# Altium schematic sheet LAN 485.SchDoc
size A3; SheetNumber: 2; SheetTotal: 3
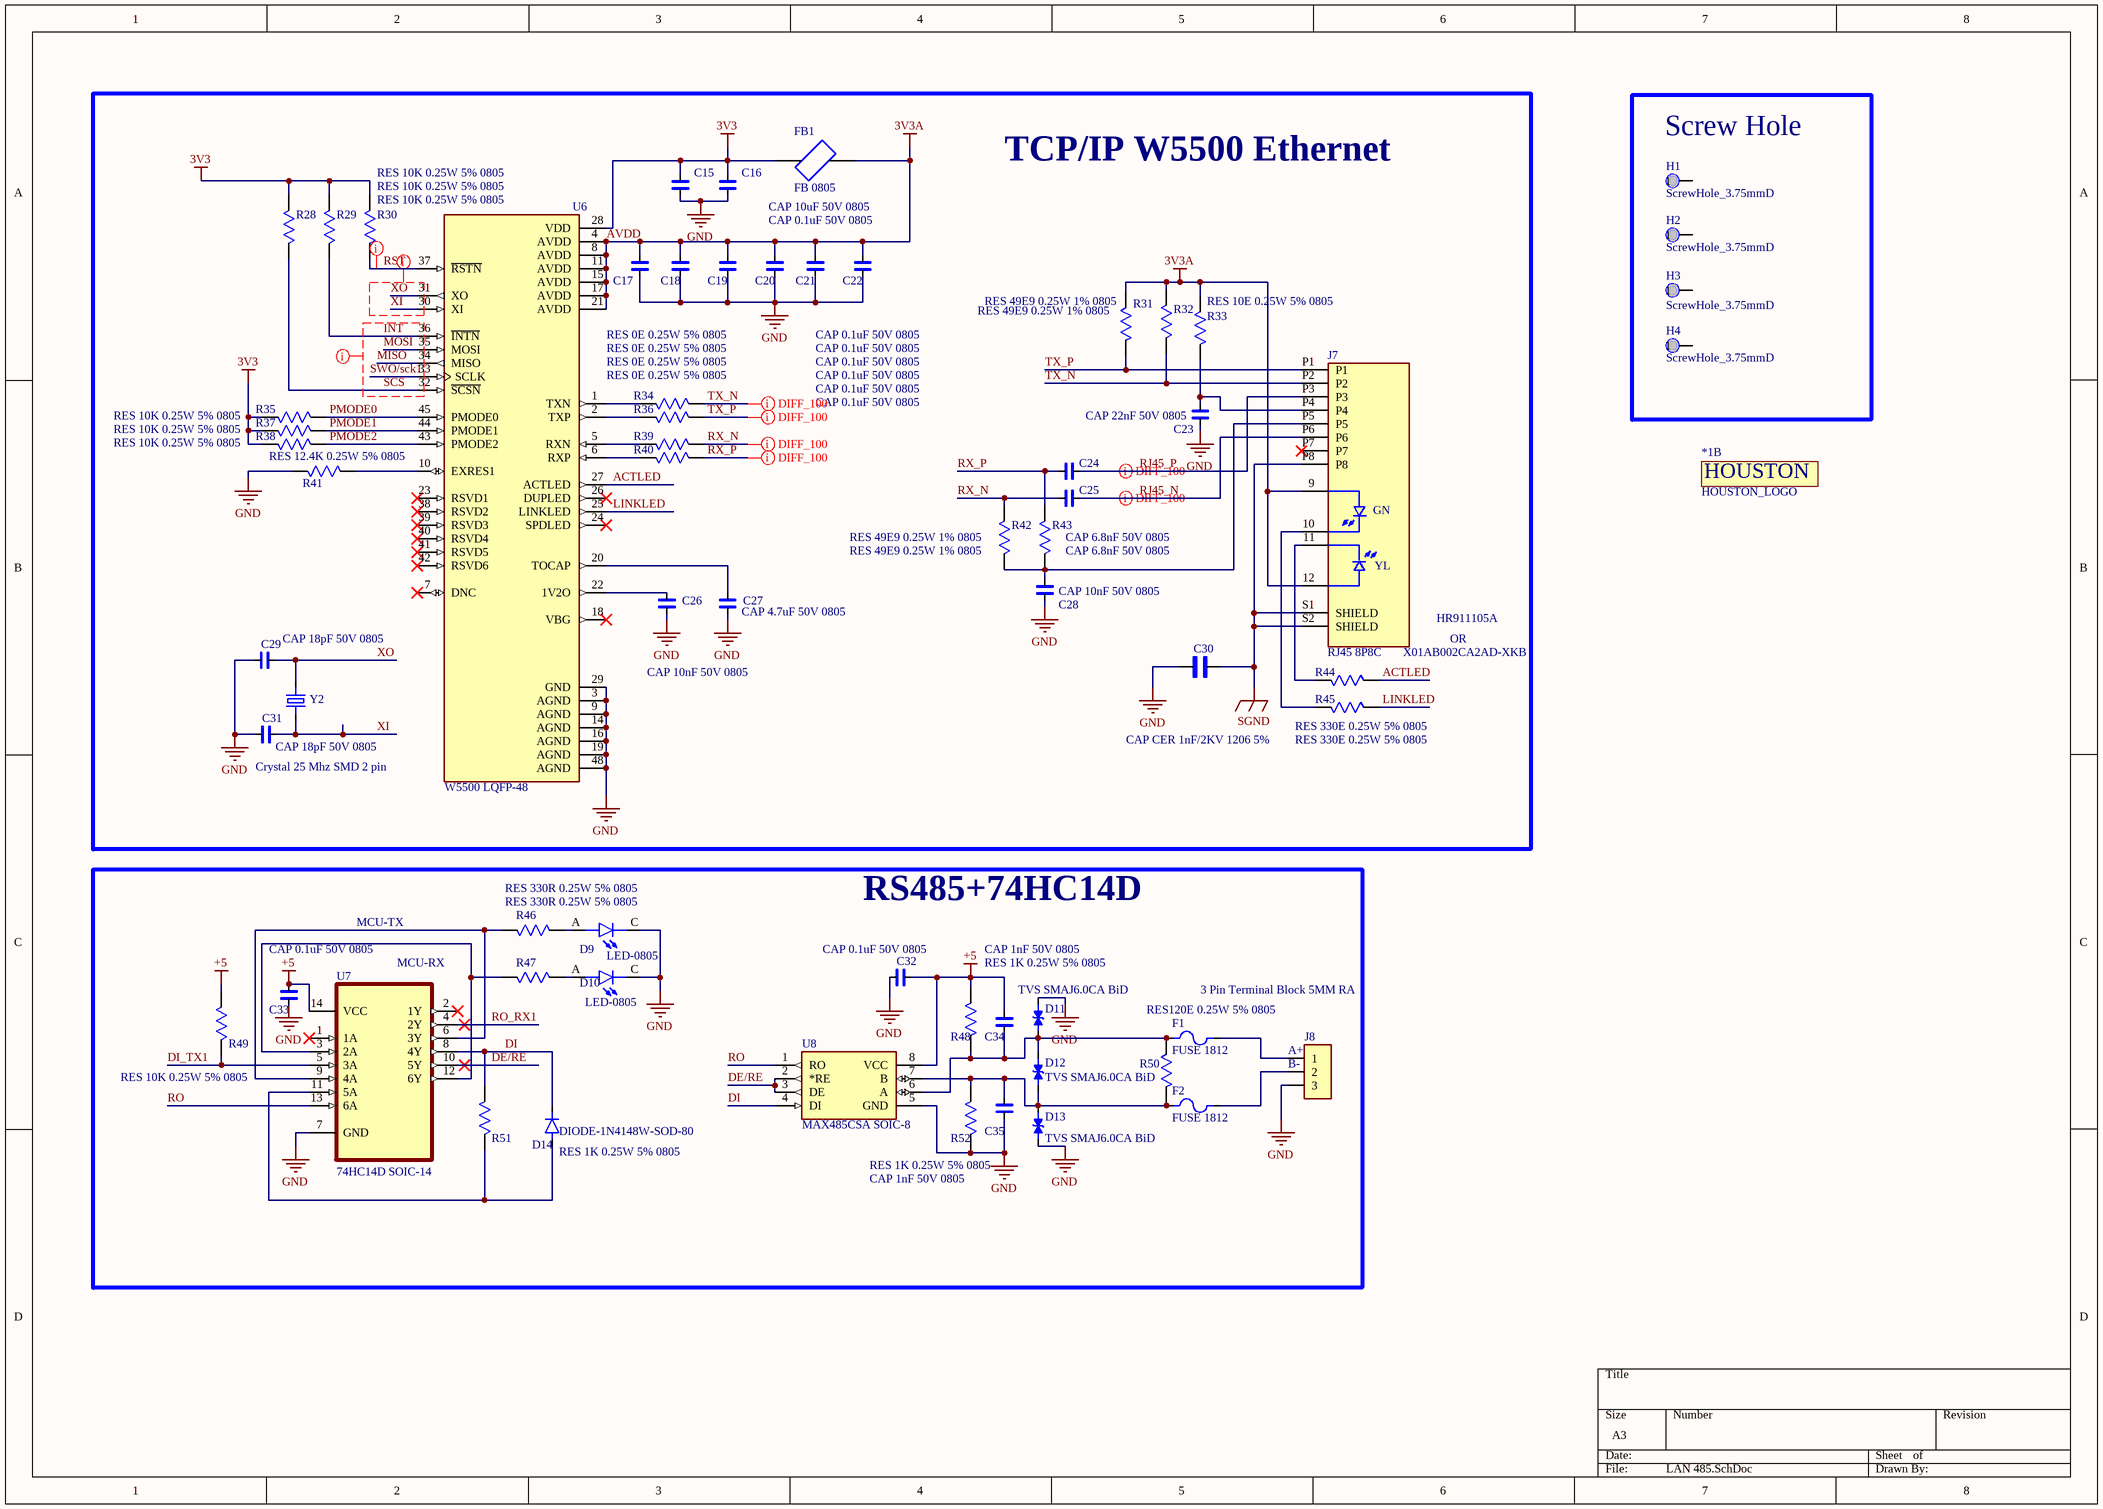
[diagram p0: LAN 485.SchDoc]

## Parts
*1  HOUSTON_LOGO  [HOUSTON_LOGO]  (part B of 2)
C15  CAP 0.1uF 50V 0805  [CAP CER 0.1uF/50V 5%]
C16  CAP 10uF 50V 0805  [CAP CER 0.1uF/50V 5%]
C17  CAP 0.1uF 50V 0805  [CAP CER 0.1uF/50V 5%]
C18  CAP 0.1uF 50V 0805  [CAP CER 0.1uF/50V 5%]
C19  CAP 0.1uF 50V 0805  [CAP CER 0.1uF/50V 5%]
C20  CAP 0.1uF 50V 0805  [CAP CER 0.1uF/50V 5%]
C21  CAP 0.1uF 50V 0805  [CAP CER 0.1uF/50V 5%]
C22  CAP 0.1uF 50V 0805  [CAP CER 0.1uF/50V 5%]
C23  CAP 22nF 50V 0805  [CAP CER 0.1uF/50V 5%]
C24  CAP 6.8nF 50V 0805  [CAP CER 0.1uF/50V 5%]
C25  CAP 6.8nF 50V 0805  [CAP CER 0.1uF/50V 5%]
C26  CAP 10nF 50V 0805  [CAP CER 0.1uF/50V 5%]
C27  CAP 4.7uF 50V 0805  [CAP CER 0.1uF/50V 5%]
C28  CAP 10nF 50V 0805  [CAP CER 0.1uF/50V 5%]
C29  CAP 18pF 50V 0805  [CAP CER 0.1uF/50V 5%]
C30  CAP CER 1nF/2KV 1206 5%  [CAP CER 1nF/2KV 1206 5%]
C31  CAP 18pF 50V 0805  [CAP CER 0.1uF/50V 5%]
C32  CAP 0.1uF 50V 0805  [CAP CER 0.1uF/50V 5%]
C33  CAP 0.1uF 50V 0805  [CAP CER 0.1uF/50V 5%]
C34  CAP 1nF 50V 0805  [CAP CER 0.1uF/50V 5%]
C35  CAP 1nF 50V 0805  [CAP CER 0.1uF/50V 5%]
D9  LED-0805  [LED-0805]
D10  LED-0805  [LED-0805]
D11  TVS SMAJ6.0CA BiD  [TVS SMAJ6.0CA DO-214AC (SMA)]
D12  TVS SMAJ6.0CA BiD  [TVS SMAJ6.0CA DO-214AC (SMA)]
D13  TVS SMAJ6.0CA BiD  [TVS SMAJ6.0CA DO-214AC (SMA)]
D14  DIODE-1N4148W-SOD-80  [DIODE-1N4148W-SOD-80]
F1  FUSE 1812  [FUSE 1812]
F2  FUSE 1812  [FUSE 1812]
FB1  FB 0805  [FB 0805]
H1  ScrewHole_3.75mmD  [ScrewHole_3.75mmD - duplicate]
H2  ScrewHole_3.75mmD  [ScrewHole_3.75mmD - duplicate]
H3  ScrewHole_3.75mmD  [ScrewHole_3.75mmD - duplicate]
H4  ScrewHole_3.75mmD  [ScrewHole_3.75mmD - duplicate]
J7  RJ45 8P8C  [RJ45 8P8C]
J8  3 Pin Terminal Block 5MM RA  [3 Pin Terminal Block 5MM RA]
R28  RES 10K 0.25W 5% 0805  [RES 0805 10K/0.25W 5%]
R29  RES 10K 0.25W 5% 0805  [RES 0805 10K/0.25W 5%]
R30  RES 10K 0.25W 5% 0805  [RES 0805 10K/0.25W 5%]
R31  RES 49E9 0.25W 1% 0805  [RES 0805 10K/0.25W 5%]
R32  RES 49E9 0.25W 1% 0805  [RES 0805 10K/0.25W 5%]
R33  RES 10E 0.25W 5% 0805  [RES 0805 10K/0.25W 5%]
R34  RES 0E 0.25W 5% 0805  [RES 0805 10K/0.25W 5%]
R35  RES 10K 0.25W 5% 0805  [RES 0805 10K/0.25W 5%]
R36  RES 0E 0.25W 5% 0805  [RES 0805 10K/0.25W 5%]
R37  RES 10K 0.25W 5% 0805  [RES 0805 10K/0.25W 5%]
R38  RES 10K 0.25W 5% 0805  [RES 0805 10K/0.25W 5%]
R39  RES 0E 0.25W 5% 0805  [RES 0805 10K/0.25W 5%]
R40  RES 0E 0.25W 5% 0805  [RES 0805 10K/0.25W 5%]
R41  RES 12.4K 0.25W 5% 0805  [RES 0805 10K/0.25W 5%]
R42  RES 49E9 0.25W 1% 0805  [RES 0805 10K/0.25W 5%]
R43  RES 49E9 0.25W 1% 0805  [RES 0805 10K/0.25W 5%]
R44  RES 330E 0.25W 5% 0805  [RES 0805 10K/0.25W 5%]
R45  RES 330E 0.25W 5% 0805  [RES 0805 10K/0.25W 5%]
R46  RES 330R 0.25W 5% 0805  [RES 0805 10K/0.25W 5%]
R47  RES 330R 0.25W 5% 0805  [RES 0805 10K/0.25W 5%]
R48  RES 1K 0.25W 5% 0805  [RES 0805 10K/0.25W 5%]
R49  RES 10K 0.25W 5% 0805  [RES 0805 10K/0.25W 5%]
R50  RES120E 0.25W 5% 0805  [RES 0805 10K/0.25W 5%]
R51  RES 1K 0.25W 5% 0805  [RES 0805 10K/0.25W 5%]
R52  RES 1K 0.25W 5% 0805  [RES 0805 10K/0.25W 5%]
U6  W5500 LQFP-48  [W5500 LQFP-48]
U7  74HC14D SOIC-14  [74HC14D SOIC-14]
U8  MAX485CSA SOIC-8  [MAX485CSA]
Y2  Crystal 25 Mhz SMD 2 pin  [Crystal 16 Mhz SMD 2 pin]

## Blocks framed on the sheet
TCP/IP W5500 Ethernet: C15-C31 FB1 J7 R28-R45 U6 Y2
Screw Hole: H1-H4
RS485+74HC14D: C32-C35 D9-D14 F1 F2 J8 R46-R52 U7 U8

## Nets
3V3: C15.2 C16.2 FB1.1 R28.2 R29.2 R30.2 R35.2 R37.2 R38.2 U6.28(VDD)
+5: C32.1 C33.2 C34.2 R48.1 R49.2 U7.14(VCC) U8.8(VCC)
AVDD: C17.2 C18.2 C19.2 C20.2 C21.2 C22.2 FB1.2 J7.9 J7.12 R31.2 R32.2 R33.2 U6.4(AVDD) U6.8(AVDD) U6.11(AVDD) U6.15(AVDD) U6.17(AVDD) U6.21(AVDD)  [also labelled 3V3A]
GND: C15.1 C16.1 C17.1 C18.1 C19.1 C20.1 C21.1 C22.1 C23.1 C26.1 C27.1 C28.1 C29.2 C30.1 C31.2 C32.2 C33.1 C35.2 D9.C D10.C D11.2 D13.1 J8.3 R41.1 R52.1 U6.3(AGND) U6.9(AGND) U6.14(AGND) U6.16(AGND) U6.19(AGND) U6.29(GND) U6.48(AGND) U7.7(GND) U8.5(GND)
SGND: C30.2 J7.P8 J7.S1(SHIELD) J7.S2(SHIELD)
ACTLED: R44.1 U6.27(ACTLED)
DE/RE: U7.10(5Y) U8.2(*RE) U8.3(DE)
DI: D14.C(K) R51.2 U7.8(4Y) U8.4(DI)
DI_TX1: R49.1 U7.5(3A)
INT: R29.1 U6.36(~{INTN})
LINKLED: R45.1 U6.25(LINKLED)
MISO: U6.34(MISO)
MOSI: U6.35(MOSI)
PMODE0: R35.1 U6.45(PMODE0)
PMODE1: R37.1 U6.44(PMODE1)
PMODE2: R38.1 U6.43(PMODE2)
RJ45_N: C25.1 J7.P6
RJ45_P: C24.1 J7.P3
RO: U7.13(6A) U8.1(RO)
RO_RX1: U7.4(2Y)
RST: R30.1 U6.37(~{RSTN})
RX_N: C25.2 R39.1 R42.2
RX_P: C24.2 R40.1 R43.2
SCS: R28.1 U6.32(~{SCSN})
SWO/sck1: U6.33(SCLK)
TX_N: J7.P2 R32.1 R34.1
TX_P: J7.P1 R31.1 R36.1
XI: C31.1 U6.30(XI) Y2.2
XO: C29.1 U6.31(XO) Y2.1
NetC23_2: C23.2 J7.P4 R33.1
NetC26_2: C26.2 U6.22(1V2O)
NetC27_2: C27.2 U6.20(TOCAP)
NetC28_2: C28.2 J7.P5 R42.1 R43.1
NetC34_1: C34.1 D11.1 D12.2 F1.1 R48.2 R50.2 U8.6(A)
NetC35_1: C35.1 D12.1 D13.2 F2.1 R50.1 R52.2 U8.7(B)
NetD9_A: D9.A R46.1
NetD10_A: D10.A R47.1
NetD14_A: D14.A R51.1 U7.11(5A)
NetF1_2: F1.2 J8.1
NetF2_2: F2.2 J8.2
NetJ7_10: J7.10 R45.2
NetJ7_11: J7.11 R44.2
NetR34_2: R34.2 U6.1(TXN)
NetR36_2: R36.2 U6.2(TXP)
NetR39_2: R39.2 U6.5(RXN)
NetR40_2: R40.2 U6.6(RXP)
NetR41_2: R41.2 U6.10(EXRES1)
NetR46_2: R46.2 U7.6(3Y) U7.9(4A)
NetR47_2: R47.2 U7.3(2A) U7.12(6Y)

Not connected (* = marked no-connect by the designer): H1 1; H2 1; H3 1; H4 1; J7 P7*; U6 7(DNC)* 18(VBG)* 23(RSVD1)* 24(SPDLED)* 26(DUPLED)* 38(RSVD2)* 39(RSVD3)* 40(RSVD4)* 41(RSVD5)* 42(RSVD6)*; U7 1(1A)* 2(1Y)*

## Layout directives
net class Single_50 ohm: INT, MISO, MOSI, RST, SCS, SWO/sck1, XI, XO
differential pair; differential pair class DIFF_100: RJ45_N, RJ45_P, RX_N, RX_P, TX_N, TX_P

## Notes on the sheet
- HR911105A
- OR
- X01AB002CA2AD-XKB
- MCU-TX
- (near U7) MCU-RX
- (near J8) A+
- (near J8) B-
- (in symbol HOUSTON_LOGO, part B) HOUSTON
- (in symbol RJ45 8P8C) GN; YL

## Library data of the parts
C15-C29 C31-C35 = CAP CER 0.1uF/50V 5%: CAP CER 0.1uF/50V  Ceramic Capacitor X7R 0805 (2012 Metric) SMT; MF: Samsung; MP: CL21B104KCFNNNE; Purchase-URL: https://pricing.snapeda.com/search?q=CL21B104KCFNNNE&ref=eda; Package: 0805 Samsung; Check_prices: https://www.snapeda.com/parts/CL21B104KCFNNNE/Samsung+Electro-Mechanics/view-part/?ref=eda; Value: *; SnapEDA_Link: https://www.snapeda.com/parts/CL21B104KCFNNNE/Samsung+Electro-Mechanics/view-part/?ref=snap; Digi-Key_Part_Number: 1276-6840-2-ND
C30 = CAP CER 1nF/2KV 1206 5%: 1000 pF Â±10% 2000V (2kV) Ceramic Capacitor X7R 1206 (3216 Metric) C1206C102KGRACAUTO; MF: KEMET; SnapEDA_Link: https://www.snapeda.com/parts/C1206C102KGRACAUTO/KEMET/view-part/?ref=snap; Package: 3216 KEMET; Value: *; MP: C1206C102KGRACAUTO; Check_prices: https://www.snapeda.com/parts/C1206C102KGRACAUTO/KEMET/view-part/?ref=eda
D9 D10 = LED-0805: Red 640nm LED Indication - Discrete 1.85V 0805 (2012 Metric) APT2012SRCPRV; MF: Kingbright; SnapEDA_Link: https://www.snapeda.com/parts/APT2012SRCPRV/Kingbright/view-part/?ref=snap; Package: 0805 Kingbright; Value: *; MP: APT2012SRCPRV; Check_prices: https://www.snapeda.com/parts/APT2012SRCPRV/Kingbright/view-part/?ref=eda
D11-D13 = TVS SMAJ6.0CA DO-214AC (SMA): SMAJ6.0CA WG Bidirectional TVS diode littlefuse DO-214AC (SMA); MP: SMAJ7.5CA; Availability: Unavailable; Package: None; Value: *; Price: None
D14 = DIODE-1N4148W-SOD-80: DIODE-1N4148W-SOD-80 is a general-purpose silicon diode LL4148_L1G; MP: LL4148_L1G; Price: None; Package: None; Availability: Unavailable; Value: *
F1 F2 = FUSE 1812: Polymeric PTC Resettable Fuse 60V 100 mA Ih Surface Mount 1812 (4532 Metric), Concave, MF-MSMF010-2; MF: Bourns; Price: None; Availability: In Stock; MP: MF-MSMF010-2; Package: 1812 Bourns; SnapEDA_Link: https://www.snapeda.com/parts/MF-MSMF010-2/Bourns/view-part/?ref=snap; Check_prices: https://www.snapeda.com/parts/MF-MSMF010-2/Bourns/view-part/?ref=eda; Value: *; Purchase-URL: https://pricing.snapeda.com/search/part/MF-MSMF010-2/?ref=eda
FB1 = FB 0805: MH2029-101Y-Bourns Inc.-Ferrite Bead, 100 Ohms @ 100 MHz , Signal Line Ferrite Bead 0805 (2012 Metric) 2A 100mOhm; MP: MPZ2012S102AT000; Package: None; Price: None; Value: *; Availability: Unavailable
H1-H4 = ScrewHole_3.75mmD: SCREW HEAD DIA 4.5MM, SREW LEG DIA 3 MM
J7 = RJ45 8P8C: 10/100 BaseT, 8P8C, Horizontal, Shielded, LED, Through Hole, 6 Âµin Plating, RJ45 with Integrated Magnetics Modular Connector CRJ011-ML1-TH; MF: Same Sky; SnapEDA_Link: https://www.snapeda.com/parts/CRJ011-ML1-TH/Same+Sky/view-part/?ref=snap; Package: None; Value: *; MP: CRJ011-ML1-TH; Check_prices: https://www.snapeda.com/parts/CRJ011-ML1-TH/Same+Sky/view-part/?ref=eda
J8 = 3 Pin Terminal Block 5MM RA: 3 Pin Terminal Block HDR 5MM THT RA 231-433_001-000; MP: 231-433/001-000; MF: WAGO; SnapEDA_Link: https://www.snapeda.com/parts/231-433/001-000/WAGO/view-part/482062/?ref=snap; Package: None; Availability: Unavailable; Price: None; Value: *
R28-R52 = RES 10K 0.25W 5% 0805: RESISTOR, THICK FILM, 10K, 5%, 0805 0.25W SMT; MP: ERJ-6GEYJ103V; MF: Panasonic Electronic; Price: None; Check_prices: https://www.snapeda.com/parts/ERJ-6GEYJ103V/Panasonic+Electronic+Components/view-part/?ref=eda; Package: 805-2 Panasonic; Purchase-URL: https://pricing.snapeda.com/search/part/ERJ-6GEYJ103V/?ref=eda; Availability: In Stock; SnapEDA_Link: https://www.snapeda.com/parts/ERJ-6GEYJ103V/Panasonic+Electronic+Components/view-part/?ref=snap; Value: *
U6 = W5500: W5500 LQFP-48 Hardwired TCP/IP embedded Ethernet controller; Availability: Unavailable; MP: W5500; Value: *; Price: None; Package: None
U7 = 74HC14D,653: Inverter IC 6 Channel Schmitt Trigger 14-SO/SOIC-14; MF: Nexperia USA; SnapEDA_Link: https://www.snapeda.com/parts/74HC14D,653/Nexperia/view-part/?ref=snap; Package: SO14-14 Nexperia USA Inc.; Value: *; MP: 74HC14D,653; Check_prices: https://www.snapeda.com/parts/74HC14D,653/Nexperia/view-part/?ref=eda
U8 = MAX485CSA: MAX485CSA-RS-485/RS-422 Transceivers, SOIC-8; MF: Analog Devices; MP: MAX485CSA+; SnapEDA_Link: https://www.snapeda.com/parts/MAX485CSA+/Analog+Devices/view-part/?ref=snap; Package: SOIC-8 Maxim; Value: *; Check_prices: https://www.snapeda.com/parts/MAX485CSA+/Analog+Devices/view-part/?ref=eda
Y2 = Crystal 16 Mhz SMD 2 pin_1: 16 MHz Â±30ppm Crystal 20pF 60 Ohms HC-49/US FOXSDLF/128-20 16 Mhz Crystal SMD –CSM-4ALX(28ALX) 12.5mmX4.85mmX4mm; MF: Fox Electronics; SnapEDA_Link: https://www.snapeda.com/parts/FOXSDLF/128-20/Fox+Electronics/view-part/?ref=snap; Package: HC49SD Fox Electronics; Value: *; MP: FOXSDLF/128-20; Check_prices: https://www.snapeda.com/parts/FOXSDLF/128-20/Fox+Electronics/view-part/?ref=eda